# EAGLE design source_eagle (EAGLE 6.3)
COMPANY: ADAFRUIT INDUSTRIES; DRAWN: LADYADA; REV: A
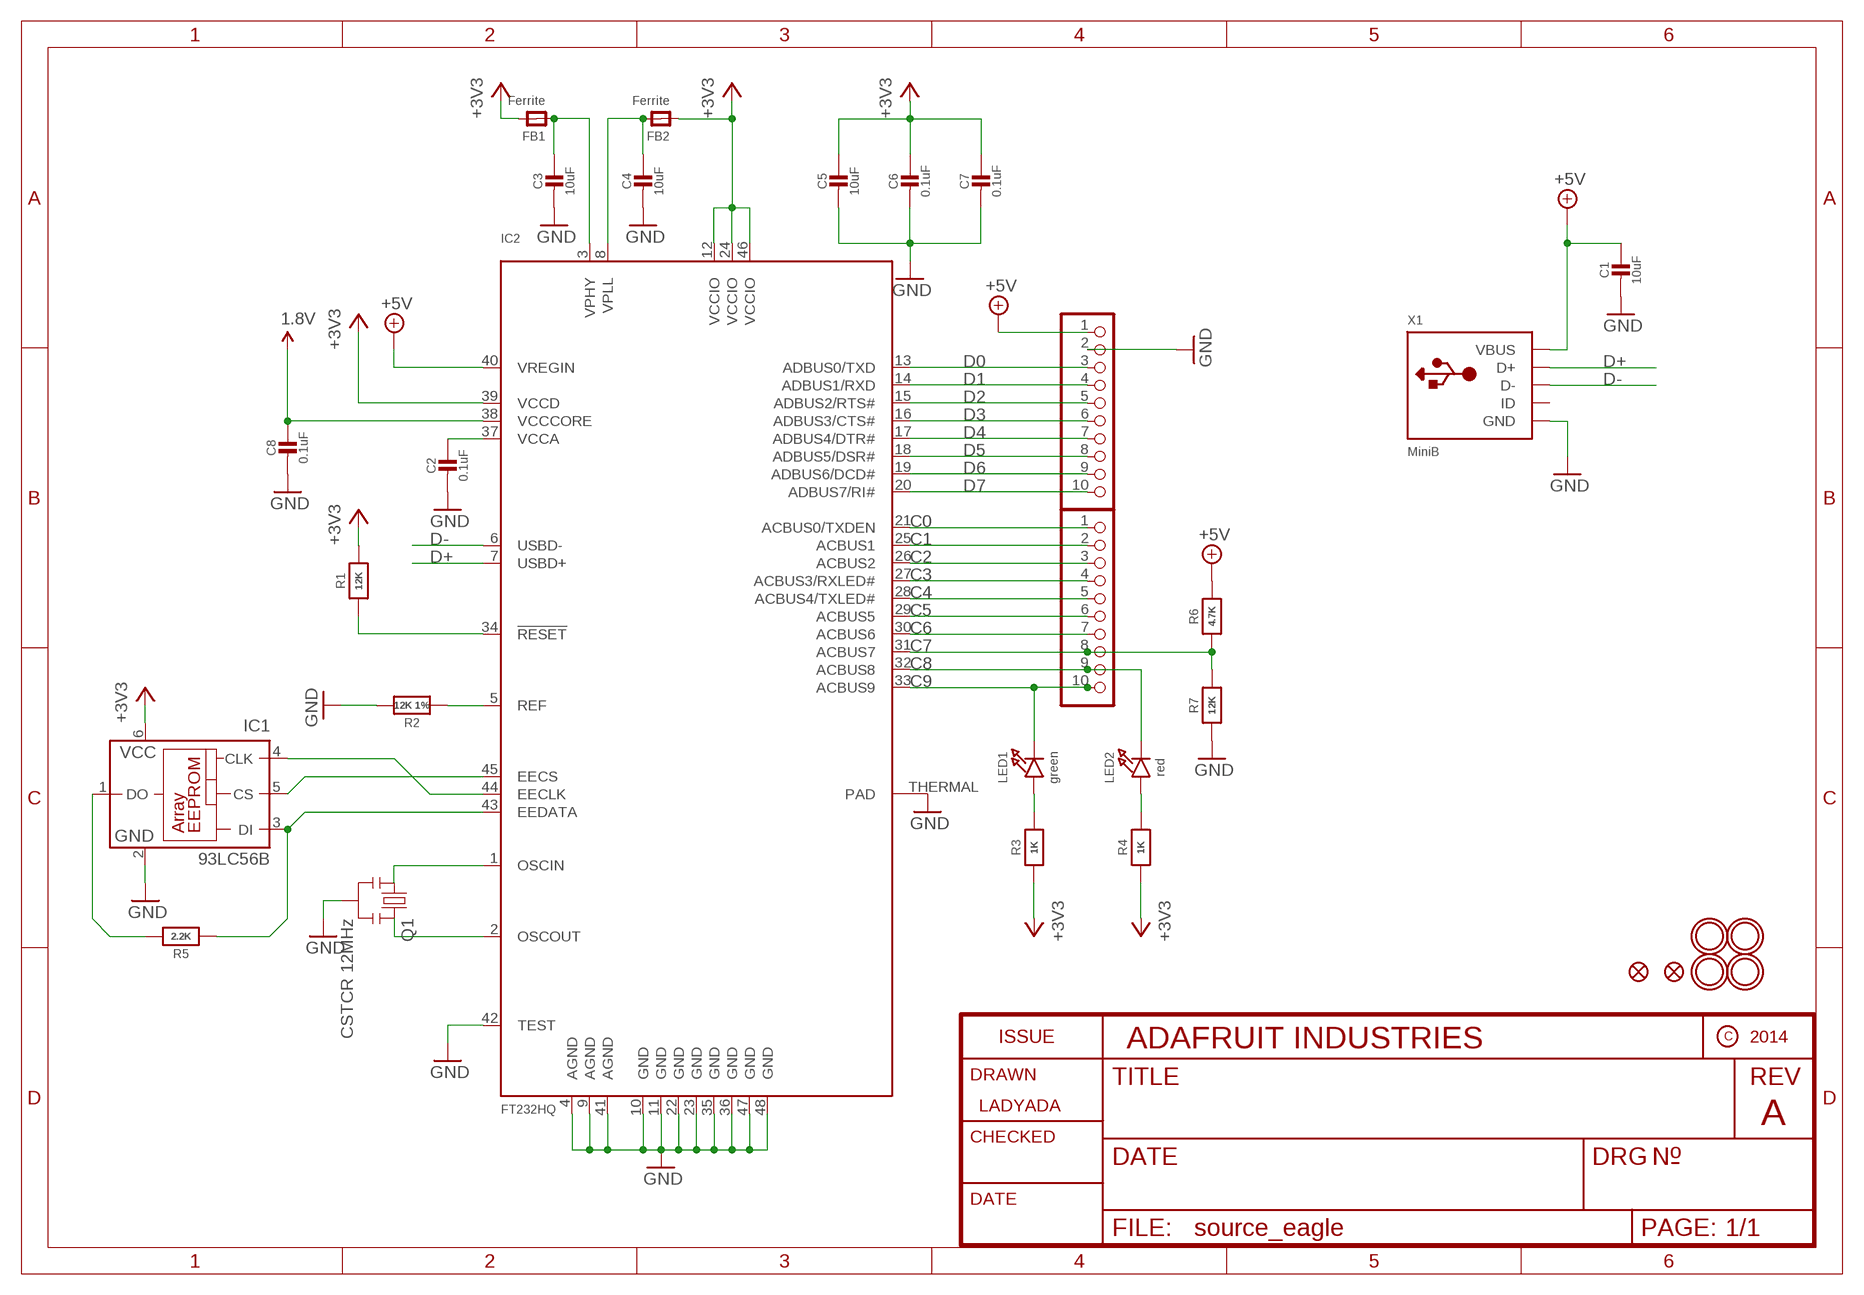
[diagram p0: schematic, sheet 1]

## Parts
C1  10uF  CAP_CERAMIC0805-NOOUTLINE  [0805-NO]
C2  0.1uF  CAP_CERAMIC0805-NOOUTLINE  [0805-NO]
C3  10uF  CAP_CERAMIC0805-NOOUTLINE  [0805-NO]
C4  10uF  CAP_CERAMIC0805-NOOUTLINE  [0805-NO]
C5  10uF  CAP_CERAMIC0805-NOOUTLINE  [0805-NO]
C6  0.1uF  CAP_CERAMIC0805-NOOUTLINE  [0805-NO]
C7  0.1uF  CAP_CERAMIC0805-NOOUTLINE  [0805-NO]
C8  0.1uF  CAP_CERAMIC0805-NOOUTLINE  [0805-NO]
FB1  Ferrite  FERRITE_0805  [_0805]
FB2  Ferrite  FERRITE_0805  [_0805]
FID1  FIDUCIAL""  [FIDUCIAL_1MM]
FID2  FIDUCIAL""  [FIDUCIAL_1MM]
IC1  93LC56B  93LC76A  [SOT23-6]
IC2  FT232HQ  [QFN48_8MM]
LED1  green  LED0805_NOOUTLINE  [CHIPLED_0805_NOOUTLINE]
LED2  red  LED0805_NOOUTLINE  [CHIPLED_0805_NOOUTLINE]
Q1  CSTCR 12MHz  RESONATORSMD  [RESONATOR-SMD]
R1  12K  RESISTOR0805_NOOUTLINE  [0805-NO]
R2  12K 1%  RESISTOR0805_NOOUTLINE  [0805-NO]
R3  1K  RESISTOR0805_NOOUTLINE  [0805-NO]
R4  1K  RESISTOR0805_NOOUTLINE  [0805-NO]
R5  2.2K  RESISTOR_0805MP  [_0805MP]
R6  4.7K  RESISTOR0805_NOOUTLINE  [0805-NO]
R7  12K  RESISTOR0805_NOOUTLINE  [0805-NO]
U$2  PINHD-1X10  [1X10-BIG]
U$3  PINHD-1X10  [1X10-BIG]
U$4  MOUNTINGHOLE2.5  [MOUNTINGHOLE_2.5_PLATED]
U$5  MOUNTINGHOLE2.5  [MOUNTINGHOLE_2.5_PLATED]
U$6  MOUNTINGHOLE2.5  [MOUNTINGHOLE_2.5_PLATED]
U$7  MOUNTINGHOLE2.5  [MOUNTINGHOLE_2.5_PLATED]
X1  MiniB  USBMICRO_20329  [4UCONN_20329]

## Nets
1.8V: C8.1 IC2.38(VCCCORE)
+3V3: C5.1 C6.1 C7.1 FB1.2 FB2.1 IC1.6(VCC) IC2.12(VCCIO) IC2.24(VCCIO) IC2.39(VCCD) IC2.46(VCCIO) R1.2 R3.1 R4.1
+5V: C1.1 IC2.40(VREGIN) R6.2 U$2.1 X1.VBUS
C0: IC2.21(ACBUS0/TXDEN) U$3.1
C1: IC2.25(ACBUS1) U$3.2
C2: IC2.26(ACBUS2) U$3.3
C3: IC2.27(ACBUS3/RXLED#) U$3.4
C4: IC2.28(ACBUS4/TXLED#) U$3.5
C5: IC2.29(ACBUS5) U$3.6
C6: IC2.30(ACBUS6) U$3.7
C7: IC2.31(ACBUS7) R6.1 R7.2 U$3.8
C8: IC2.32(ACBUS8) LED2.C U$3.9
C9: IC2.33(ACBUS9) LED1.C U$3.10
D0: IC2.13(ADBUS0/TXD) U$2.3
D1: IC2.14(ADBUS1/RXD) U$2.4
D2: IC2.15(ADBUS2/RTS#) U$2.5
D3: IC2.16(ADBUS3/CTS#) U$2.6
D4: IC2.17(ADBUS4/DTR#) U$2.7
D5: IC2.18(ADBUS5/DSR#) U$2.8
D6: IC2.19(ADBUS6/DCD#) U$2.9
D7: IC2.20(ADBUS7/RI#) U$2.10
D+: IC2.7(USBD+) X1.D+
D-: IC2.6(USBD-) X1.D-
GND: C1.2 C2.2 C3.2 C4.2 C5.2 C6.2 C7.2 C8.2 IC1.2(GND) IC2.4(AGND) IC2.9(AGND) IC2.10(GND) IC2.11(GND) IC2.22(GND) IC2.23(GND) IC2.35(GND) IC2.36(GND) IC2.41(AGND) IC2.42(TEST) IC2.47(GND) IC2.48(GND) IC2.THERMAL(PAD) Q1.2 R2.2 R7.1 U$2.2 X1.BASE@1(GND) X1.BASE@2(GND) X1.GND X1.SPRT@1(GND) X1.SPRT@2(GND) X1.SPRT@3(GND) X1.SPRT@4(GND)
N$2: IC2.1(OSCIN) Q1.1
N$3: IC2.2(OSCOUT) Q1.3
N$5: IC2.5(REF) R2.1
N$6: LED2.A R4.2
N$7: IC2.34(!RESET) R1.1
N$8: LED1.A R3.2
N$9: IC1.3(DI) IC2.43(EEDATA) R5.1
N$10: IC1.5(CS) IC2.45(EECS)
N$11: IC1.4(CLK) IC2.44(EECLK)
N$12: IC1.1(DO) R5.2
VCCA: C2.1 IC2.37(VCCA)
VPHY: C3.1 FB1.1 IC2.3(VPHY)
VPLL: C4.1 FB2.2 IC2.8(VPLL)
Unconnected: X1.ID

## Library data of the parts
C1-C8 = microbuilder:CAP_CERAMIC: Ceramic Capacitors For new designs, use the packages preceded by an '_' character since they are more reliable: The following footprints should be used on most boards: _0402 - Standard footprint for regular board layouts _0603 - Standard footprint for regular board layouts _0805 - Standard footprint for regular board layouts _1206 - Standard footprint for regular board layouts For extremely tight-pitch boards where space is at a premium, the following 'micro-pitch' footprints can be used (smaller pads, no silkscreen outline, etc.): _0402MP - Micro-pitch footprint for very dense/compact boards _0603MP - Micro-pitch footprint for very dense/compact boards _0805MP - Micro-pitch footprint for very dense/compact boards _1206MP - Micro-pitch footprint for very dense/compact boards
FB1 FB2 = microbuilder:FERRITE: Ferrite Bead 0603 MMZ1608B121C - 120 Ohm @ 100MHz, 600mA, 0.15 Ohm DC Resistance - Digikey: 445-2164-1-ND BK1608HW121-T - 120 Ohm, 600mA Ferrite Chip - Digikey: 587-1876-2-ND 0805 HZ0805B272R-10 - 2.7K Ohm @ 100MHz, 200mA, 0.8 Ohm DC Resistance - Digikey: 240-2504-1-ND (see also Murata BLM21BD272SN1L) MMZ2012Y152B - 1.5K Ohm @ 100MHz, 500mA, 0.4 Ohm DC Resistance - Digikey: 445-1560-1-ND - Mainly for high frequency (80-400MHz) MMZ2012R102A - 1K Ohm @ 100MHz, 500mA, 0.3 Ohm DC Resistance - Digikey: 445-1555-2-ND - More general purpose (10-200MHz)
FID1 FID2 = microbuilder:FIDUCIAL: Fiducial Alignment Points Various fiducial points for machine vision alignment.; BOM: EXCLUDE
IC1 = microchip:93*76?: 8K Microwire Compatible Serial EEPROM Source: http://ww1.microchip.com/downloads/en/DeviceDoc/21796H.pdf; MF: MICROCHIP; MPN: 93LC76AT-I/OT; OC_FARNELL: 1556170; OC_NEWARK: 61H6824
IC2 = microbuilder:FT232H
LED1 LED2 = microbuilder:LED: LED 0603 - 0603 Surface Mount Package 2mA: Green LED - Low Power (3.9mcd, 2ma, 1.7Vf) - Digikey: 475-2709-2-ND Orange LED - Low Power (9.8mcd, 2ma, 1.8Vf) - Digikey: 475-1194-2-ND Red LED - Low Power (5mcd, 2ma, 1.8Vf) - Digikey: 475-1195-2-ND Yellow LED - Low Power (7mcd, 2ma, 1.8Vf) - Digikey: 475-1196-2-ND 5mA: Blue LED - Low Power (17mcd, 5ma, 2.9Vf) - Digikey: LNJ937W8CRACT-ND 0805 - 0805 Surface Mount Package 2mA: Red LED (8.8mcd, 2mA, 1.8Vf, Clear) - Low Power [Digikey: 475-2510-1-ND] Green LED (5mcd, 2mA, 1.8Vf, Clear) - Low Power [Digikey: 475-2730-1-ND] Yellow LED (11.3mcd, 2mA, 1.8Vf, Clear) - Low Power [Digikey: 475-2555-1-ND] 20mA: Red LED (104mcd, 20mA, Diffused) - LS R976 [Digikey: 475-1278-6-ND] Red LED (12mcd, 20mA, 2.0Vf, Clear) - APT2012EC [Digikey: 754-1128-1-ND] Green LED (15mcd, 20mA, 2.2Vf, Clear) - APT2012GC [Digikey: 754-1131-1-ND] Orange LED (160mcd, 20mA, 2.1Vf, Clear) - APT2012SECK [Digikey: 754-1130-1-ND] 1206 - 1206 Surface Mount Package Green LED (26mcd, 20mA, Diffused) - LG N971 [Digikey: 475-1407-6-ND] Red LED (15mcd, 20mA, Diffused) - LH N974 [Digikey: 475-1416-6-ND] Cree - Cree High-Power Surface Mount LEDs XPEBWT-L1-0000-00D50 - White 111lm 350mA 2.9Vf 6200K 110° XTEAWT-00-0000-00000LEE3 - White 114lm 350mA 2.85Vf 5000K 115° Everlight - Everlight 45-21 Series Surface Mount LEDs 45-21/QK2C-B2832AC2CB2/2T - Warm White 2000mcd 20mA 3.25Vf 3050K 120° 45-21/LK2C-B38452C4CB2/2T - Nuetral White 2000mcd 20mA 3.25Vf 4150K 120° 45-21/LK2C-B50634C6CB2/2T - Cold White 2200mcd 20mA 3.25Vf 5650K 120° PLCC2 Reverse Mount LS T77K-J1L2-1-0-2-R18-Z - Red 11.25mcd 2mA 1.8Vf 630nm 120° LO T77K-L1M2-24-Z - Orange 19.6mcd 2mA 1.8Vf 606nm 120° LY T77K-K2M1-26-Z - Yellow 15.7mcd 2mA 1.8Vf 587nm 120°
Q1 = SparkFun:RESONATOR: Resonator Small SMD resonator. This is the itty bitty 10/20MHz resonators with built in caps. CSTCE10M0G55 and CSTCE20M0V53. Footprint has been reviewed closely but hasn't been tested yet.
R1-R7 = microbuilder:RESISTOR: Resistors For new designs, use the packages preceded by an '_' character since they are more reliable: The following footprints should be used on most boards: _0402 - Standard footprint for regular board layouts _0603 - Standard footprint for regular board layouts _0805 - Standard footprint for regular board layouts _1206 - Standard footprint for regular board layouts For extremely tight-pitch boards where space is at a premium, the following 'micro-pitch' footprints can be used (smaller pads, no silkscreen outline, etc.): _0402MP - Micro-pitch footprint for very dense/compact boards _0603MP - Micro-pitch footprint for very dense/compact boards _0805MP - Micro-pitch footprint for very dense/compact boards _1206MP - Micro-pitch footprint for very dense/compact boards
U$2 U$3 = adafruit2:PINHD-1X10: Pin header 1x10 0.1" spacing With round pins
U$4-U$7 = microbuilder:MOUNTINGHOLE: Mounting Hole For #2 screws (0.086"/2.18mm width, 0.094"/2.4mm hole) use 2.5mm; BOM: EXCLUDE
X1 = microbuilder:USB: USB Connectors USBMINIB - Surface Mount Female Mini-B USB Connector 4UConnector: 06564

## Board
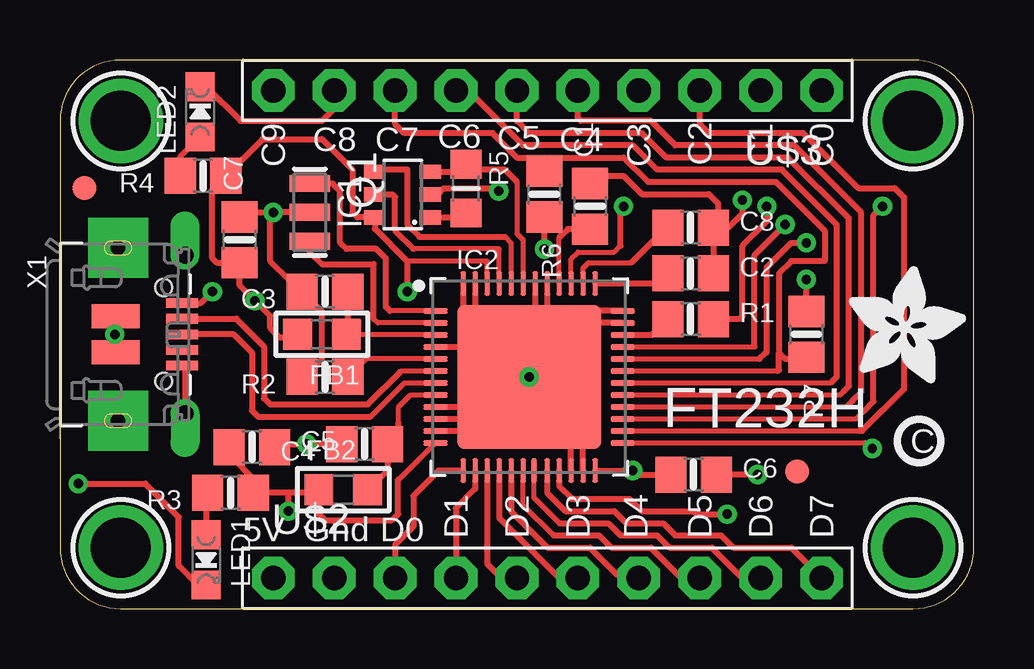
[diagram p1: board, top side]
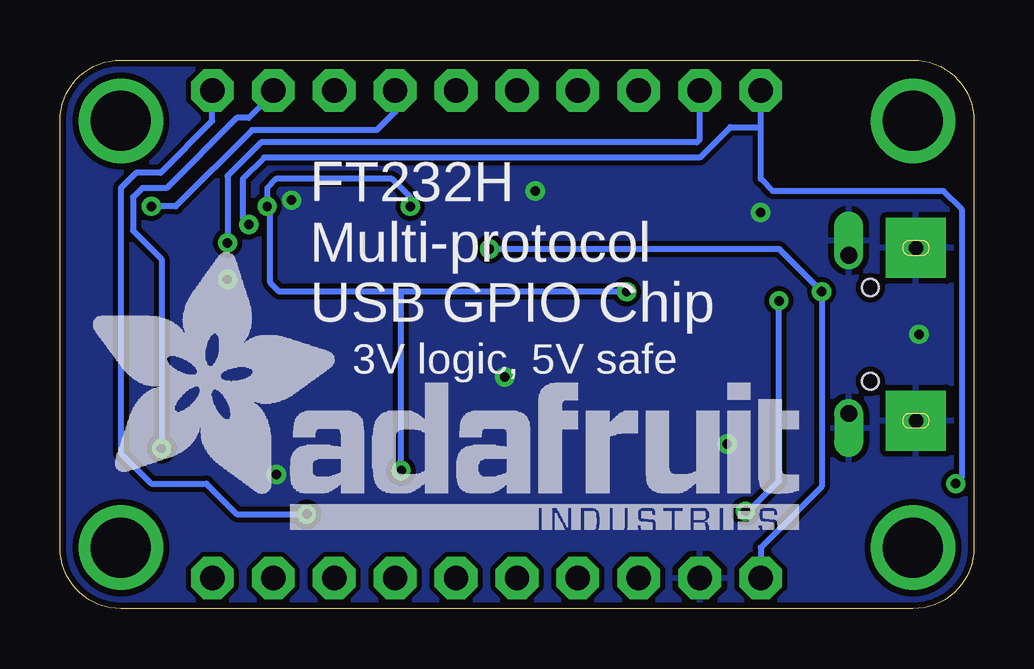
[diagram p2: board, bottom side, seen from below]

Size 38.1 x 22.86 mm. Coordinates in mm from the lower left corner, seen from the top.
Outline: 0,20.32 0,2.54 arc90 2.54,0 35.56,0 arc90 38.1,2.54 38.1,20.32 arc90 35.56,22.86 2.54,22.86 arc90 0,20.32
Copper layers (1*16): Top 0.035mm / dielectric 1.5mm / Bottom 0.035mm
Design rules "adafruit *": minimum track width 8mil, minimum drill 15.5mil, track to track 8mil, track to pad 8mil, pad to pad 8mil, via to via 8mil, smd to smd 8mil, copper to edge 10mil, drill to drill 8mil, minimum pad ring 10mil, minimum via ring 8mil, stop-mask expansion 2mil, vias tented up to drill 20mil, thermal gap 10mil

### Footprints (pad centres in the part's own frame; a part is rotated, then mirrored left to right if it is on the bottom)
0805-NO = smd 1.3 x 1.5: 1 -0.95,0; 2 0.95,0
_0805 = smd 1.2 x 1.3: 1 -1.016,0; 2 1.016,0
FIDUCIAL_1MM = smd 1 x 1: 1 0,0
SOT23-6 = smd 0.6 x 0.9: 1 -0.95,-1.15; 2 0,-1.15; 3 0.95,-1.15; 4 0.95,1.15; 5 0,1.15; 6 -0.95,1.15
QFN48_8MM = smd 1 x 0.23: 1 -3.9,2.75; 2 -3.9,2.25; 3 -3.9,1.75; 4 -3.9,1.25; 5 -3.9,0.75; 6 -3.9,0.25; 7 -3.9,-0.25; 8 -3.9,-0.75; 9 -3.9,-1.25; 10 -3.9,-1.75; 11 -3.9,-2.25; 12 -3.9,-2.75; 25 3.9,-2.75; 26 3.9,-2.25; 27 3.9,-1.75; 28 3.9,-1.25; 29 3.9,-0.75; 30 3.9,-0.25; 31 3.9,0.25; 32 3.9,0.75; 33 3.9,1.25; 34 3.9,1.75; 35 3.9,2.25; 36 3.9,2.75 | smd 0.23 x 1: 13 -2.75,-3.9; 14 -2.25,-3.9; 15 -1.75,-3.9; 16 -1.25,-3.9; 17 -0.75,-3.9; 18 -0.25,-3.9; 19 0.2,-3.9; 20 0.75,-3.9; 21 1.25,-3.9; 22 1.75,-3.9; 23 2.25,-3.9; 24 2.75,-3.9; 37 2.75,3.9; 38 2.25,3.9; 39 1.75,3.9; 40 1.25,3.9; 41 0.75,3.9; 42 0.25,3.9; 43 -0.25,3.9; 44 -0.75,3.9; 45 -1.25,3.9; 46 -1.75,3.9; 47 -2.25,3.9; 48 -2.75,3.9 | smd 6 x 6: THERMAL 0,0
CHIPLED_0805_NOOUTLINE = smd 1.2 x 1.2: A 0,-1.05; C 0,1.05
RESONATOR-SMD = smd 0.7 x 1.7: 1 -1.2,0; 2 0,0; 3 1.2,0
_0805MP = smd 1.2 x 1.3: 1 -1.016,0; 2 1.016,0
1X10-BIG = drill 1.016 pad 1.778 octagon: 1 -11.43,0; 2 -8.89,0; 3 -6.35,0; 4 -3.81,0; 5 -1.27,0; 6 1.27,0; 7 3.81,0; 8 6.35,0; 9 8.89,0; 10 11.43,0
MOUNTINGHOLE_2.5_PLATED = drill 2.5 pad 3.2: P$1 0,0
4UCONN_20329 = smd 1 x 2: BASE@1 -0.75,-2; BASE@2 0.75,-2 | smd 0.4 x 1.35: D+ 0,0.775; D- -0.65,0.775; GND 1.3,0.775; ID 0.65,0.775; VBUS -1.3,0.775 | drill 0.7 offset: SPRT@1 -3.3,0.9; SPRT@2 3.3,0.9 | drill 0.6 pad 2.5 square: SPRT@3 -3.6,-1.9; SPRT@4 3.6,-1.9 | hole 0.7: -1.95,0; 1.95,0

### Placement (x,y rotation side)
C1  22.1,16.76 90 top
C2  26.29,13.97 0 top
C3  11.05,13.21 180 top
C4  12.7,6.86 180 top
C5  8,6.73 0 top
C6  26.42,5.59 0 top
C7  7.49,15.37 90 top
C8  26.29,15.88 0 top
FB1  10.92,11.43 180 top
FB2  11.81,4.95 0 top
FID1  1.02,17.53 0 top
FID2  30.73,5.71 0 top
IC1  14.28,17.25 90 top
IC2  19.56,9.65 0 top
LED1  6.1,2.03 180 top
LED2  5.84,20.7 0 top
Q1  10.41,16.51 270 top
R1  26.29,12.06 0 top
R2  11.05,9.65 180 top
R3  7.11,4.83 180 top
R4  5.97,18.03 180 top
R5  16.92,17.5 270 top
R6  20.19,17.27 270 top
R7  31.11,11.43 270 top
U$2  20.32,1.27 0 top
U$3  20.32,21.59 180 top
U$4  2.54,20.32 0 top
U$5  2.54,2.54 0 top
U$6  35.56,20.32 0 top
U$7  35.56,2.54 0 top
U$8  [ADAFRUIT_5MM]  32.89,9.4 0 top
U$9  [ADAFRUIT_TEXT_30MM]  36.96,3.3 0 bottom
U$11  [PCBFEAT-REV-040]  35.81,6.99 0 top
X1  4.32,11.43 270 top

### Tracks (layer width: path | path; a pad name or v marks a point on that pad's centre or on a via)
1.8V
  Top 0.203: IC2.38 21.81,14.19 22.04,14.41 23.81,14.41
  Top 0.254: 23.81,14.41 25.27,15.88 C8.1
+3V3  (via drill 0.39)
  Top 0.203: IC2.12 14.14,5.38 14.1,5.38 | IC2.39 21.31,14.58 21.59,14.86 23.11,14.86 23.37,15.11 | IC2.46 17.81,14.48 14.48,14.48
  Top 0.254: 10.79,4.76 FB2.1 | FB2.1 10.79,3.94 11.05,3.68 13.84,3.68 14.1,3.94 14.1,5.38 | IC2.24 v23.88,5.75 24.04,5.59 C6.1 | FB1.2 9.78,11.3 9.14,11.3 8.76,11.68 8.76,12.19 v8.13,12.83 7.49,13.46 C7.1 6.54,14.42 6.35,14.61 6.35,17.46 R4.1 8.44,19.56 10.92,19.56 12.19,18.29 12.19,16.51 12.4,16.3 IC1.6 13.13,15.82 14.48,14.48 v14.48,13.21 | FB2.1 10.54,4.95 | 23.37,15.11 23.37,16.64 v23.5,16.76 | v29.46,16.76 29.46,16.13 28.45,15.11 28.45,12.19 28.32,12.06 R1.2 27.3,12.13 | C5.1 7.05,6.43 8.18,5.3 8.1,5.3 8.06,5.26 R3.1 9.53,4.83 | FB2.1 10.67,4.83 9.53,4.83 | v9.53,4.06 9.53,4.83
  Bottom 0.254: v8.13,12.83 8.13,5.33 9.4,4.06 v9.53,4.06 | v14.48,13.21 23.88,13.21 | 23.88,13.21 28.96,13.21 29.34,13.59 29.34,16.64 v29.46,16.76 29.46,17.53 29.08,17.91 24.26,17.91 23.5,17.14 v23.5,16.76 | v23.88,5.75 23.88,13.21
+5V  (via drill 0.39)
  Top 0.203: IC2.40 20.81,15.45
  Top 0.254: X1.VBUS 5.87,12.73 v6.35,13.21 | C1.1 21.17,15.81 20.96,15.61 | 20.96,15.61 20.81,15.45 | 20.96,15.61 20.25,16.32 R6.2 v20.19,14.99
  Bottom 0.254: U$2.1 8.89,2.54 6.35,5.08 v6.35,13.21 8.13,14.99 v20.19,14.99
C0  (via drill 0.39)
  Top 0.254: IC2.21 20.81,5.1 21.34,4.57 23.75,4.57 24.26,4.06 26.42,4.06 26.54,3.94 v27.81,3.94
  Bottom 0.254: v27.81,3.94 30.73,3.94 32,5.21 34.29,5.21 35.56,6.48 35.56,17.53 34.92,18.16 33.91,18.16 31.75,20.32 U$3.1
C1  (via drill 0.39)
  Top 0.203: IC2.25 33.57,6.9
  Top 0.254: 33.57,6.9 33.8,6.67 v33.87,6.67
  Bottom 0.254: U$3.2 29.21,21.46 30.23,20.45 30.73,20.45 33.66,17.53 34.67,17.53 35.05,17.14 35.05,15.75 33.87,14.56 v33.87,6.67
C2
  Top 0.203: IC2.26 33.31,7.4
  Top 0.254: U$3.3 26.67,20.19 27.05,19.81 30.99,19.81 33.27,17.53 34.8,17.53 35.18,17.14 35.18,9.14 33.44,7.4 33.31,7.4
C3  (via drill 0.39)
  Top 0.203: IC2.27 33.17,7.9 33.52,8.25
  Top 0.254: 33.52,8.25 33.91,8.64 33.91,16.38 v34.29,16.76
  Bottom 0.254: U$3.4 24.13,20.7 24.89,19.94 30.1,19.94 33.27,16.76 v34.29,16.76
C4
  Top 0.203: IC2.28 32.79,8.4 33.04,8.65
  Top 0.254: 33.04,8.65 33.4,9.02 33.4,16.51 30.61,19.3 25.65,19.3 24.64,20.32 21.72,20.32 21.59,20.45 U$3.5
C5
  Top 0.203: IC2.29 32.52,8.9 32.67,9.05
  Top 0.254: 32.67,9.05 32.89,9.27 32.89,16.26 30.35,18.8 25.27,18.8 24.26,19.81 19.56,19.81 19.05,20.32 U$3.6
C6
  Top 0.203: IC2.30 32.13,9.4 32.19,9.45
  Top 0.254: 32.19,9.45 32.38,9.65 32.38,16 30.1,18.29 24.89,18.29 23.88,19.3 19.3,19.3 17.02,21.59 U$3.7
C7
  Top 0.203: IC2.31 29.92,9.9
  Top 0.254: 20.19,18.8 19.05,18.8 18.03,19.81 14.35,19.81 13.97,20.19 U$3.8 | 20.19,18.8 23.5,18.8 24.51,17.78 29.84,17.78 31.88,15.75 31.88,14.48 30.48,14.48 29.97,13.97 29.97,10.67 | R6.1 20.19,18.8 | 29.97,10.67 30.23,10.41 31.05,10.41 R7.2 | 29.92,9.9 29.97,9.95 29.97,10.67
C8  (via drill 0.39)
  Top 0.203: IC2.32 29.16,10.4
  Top 0.254: U$3.9 11.43,20.83 10.92,20.32 7.53,20.32 6.1,21.75 LED2.C | v31.11,15.24 30.48,15.24 29.46,14.22 29.46,10.67 29.43,10.67 29.16,10.4
  Bottom 0.254: v31.11,15.24 31.11,18.03 29.72,19.43 11.56,19.43 11.43,19.56 U$3.9
C9  (via drill 0.39)
  Top 0.203: IC2.33 28.94,10.9 28.96,10.92
  Top 0.254: 28.96,10.92 28.96,14.73 v30.23,16 | LED1.C 5.75,0.98 4.95,1.78 4.95,3.81 3.56,5.21 v0.76,5.21
  Bottom 0.254: v30.23,16 30.48,16.26 30.48,17.91 29.59,18.8 11.43,18.8 10.16,20.07 8.89,20.07 | 8.89,20.07 8.89,17.91 8.38,17.4 1.27,17.4 0.51,16.64 0.51,5.46 v0.76,5.21 | 8.89,20.07 U$3.10
D0
  Top 0.254: IC2.13 15.79,5.75 14.73,4.7 14.73,3.43 13.97,2.67 U$2.3
D1
  Top 0.254: IC2.14 17.31,4.99 16.51,4.19 U$2.4
D2
  Top 0.254: IC2.15 17.81,1.88 18.41,1.27 U$2.5
D3
  Top 0.254: IC2.16 18.31,3.79 20.83,1.27 U$2.6
D4
  Top 0.254: IC2.17 18.81,4.05 20.32,2.54 22.1,2.54 23.24,1.4 24,1.4 U$2.7
D5
  Top 0.203: 20.57,3.05 19.31,4.31 IC2.18
  Top 0.254: 20.57,3.05 22.48,3.05 22.99,2.54 24.64,2.54 25.91,1.27 U$2.8
D6
  Top 0.203: 20.83,3.56 19.76,4.63 IC2.19
  Top 0.254: 20.83,3.56 22.86,3.56 23.37,3.05 24.89,3.05 25.4,2.54 27.18,2.54 28.45,1.27 U$2.9
D7
  Top 0.254: IC2.20 20.31,4.84 21.08,4.06 23.11,4.06 23.62,3.56 25.15,3.56 25.65,3.05 27.56,3.05 28.07,2.54 30.48,2.54 U$2.10
D+
  Top 0.203: 12.95,8 14.36,9.4 IC2.7
  Top 0.254: 12.95,8 8.26,8 8,8.26 8,10.67 7.24,11.43 X1.D+
D-
  Top 0.203: 14.17,9.85 14.22,9.9 IC2.6
  Top 0.254: 14.17,9.85 12.83,8.51 8.76,8.51 8.51,8.76 8.51,10.92 7.35,12.08 X1.D-
GND  (via drill 0.39)
  Top 0.203: IC2.42
  Top 0.254: C4.2 v10.29,6.86 9.08,6.86 C5.2 | 20.96,8.25 IC2.THERMAL | Q1.2 v8.89,16.51 | R7.1 v31.11,13.72 | 27.49,14.22 C2.2 C8.2 | v29.08,5.59 C6.2 | v18.29,17.4 18.18,17.51 15.98,17.51 15.73,17.25 IC1.2 | v28.45,17.02 28.45,16.45 27.87,15.88 C8.2 | X1.BASE@1 X1.BASE@2 2.29,10.71 v2.29,11.43 | X1.GND 5.22,10.01 X1.SPRT@2 | v8.89,16.51 8.76,16.51 8.76,14.48 9.53,13.72 9.59,13.72 C3.2 10.92,12.38 10.92,10.41 10.16,9.65 R2.2 | C7.2 7.69,16.51 v8.89,16.51 | C1.2 22.29,17.71 22.61,18.03 23.5,18.03 24.26,17.27 27.05,17.27 27.43,16.89 27.43,16.07 C8.2 | IC2.22 21.31,7.75 | 21.31,7.75 21.31,7.9 IC2.THERMAL | IC2.23 21.81,7.25 21.31,7.75 | IC2.48 16.81,12.4 IC2.THERMAL | IC2.47 17.31,11.9 IC2.THERMAL | IC2.4 18.31,10.9 IC2.THERMAL | IC2.41 20.31,10.4 IC2.THERMAL | IC2.36 22.31,12.4 IC2.THERMAL | IC2.35 21.81,11.9 IC2.THERMAL | IC2.42 19.81,9.9 IC2.THERMAL | IC2.11 17.31,7.4 IC2.THERMAL | IC2.10 17.81,7.9 IC2.THERMAL | IC2.9 18.31,8.4 IC2.THERMAL
  other vias: 19.56,9.65
  pour Bottom: 0,22.86 0,0 37.97,0 37.97,22.86
N$2
  Top 0.203: IC2.1 13.76,12.4
  Top 0.254: Q1.1 11.37,17.71 11.68,17.4 11.68,15.24 11.94,14.99 13.18,14.99 13.59,14.58 13.59,12.57 13.76,12.4
N$3
  Top 0.203: IC2.2 13.24,11.9 13.08,12.06
  Top 0.254: 13.08,12.06 13.08,14.35 10.92,14.35 10.41,14.86 Q1.3 10.41,15.34
N$5
  Top 0.203: IC2.5 12.75,10.4
  Top 0.254: 12.75,10.4 R2.1
N$6
  Top 0.254: R4.2 5.02,18.83 LED2.A
N$7
  Top 0.254: IC2.34 24.68,11.4 R1.1
N$8
  Top 0.254: R3.2 6.1,4.76 LED1.A
N$9
  Top 0.203: 19.05,17.78 19.05,15.62 19.3,15.37 IC2.43
  Top 0.254: 19.05,17.78 18.54,18.29 17.15,18.29 R5.1 16.61,18.2 IC1.3
N$10
  Top 0.203: IC2.45 18.31,14.99 14.73,14.99
  Top 0.254: 14.73,14.99 13.97,15.75 13.97,17.14 13.86,17.25 IC1.5
N$11
  Top 0.203: 18.54,15.49 18.81,15.23 IC2.44
  Top 0.254: 18.54,15.49 14.99,15.49 14.48,16 14.48,18.29 13.22,18.29 IC1.4
N$12
  Top 0.254: IC1.1 16.74,16.3 R5.2
VCCA
  Top 0.254: IC2.37 24.92,13.55 C2.1
VPHY
  Top 0.203: IC2.3 12.47,11.4 12.45,11.43
  Top 0.254: C3.1 12,11.62 11.94,11.56 FB1.1 12.45,11.94 12.45,11.43
VPLL
  Top 0.203: 14.1,7.75 14.1,8.38 14.62,8.9 IC2.8
  Top 0.254: 14.1,7.75 14.1,7.3 C4.1 13.65,5.78 FB2.2 12.76,5.02

### Text on the board
tPlace: C8 | C7 | C6 | C5 | C4 | C9 | C3 | C2 | C1 | C0 | FT232H | 5V | Gnd | D0 | D1 | D2 | D3 | D4 | D5 | D6 | D7
bPlace: FT232H / Multi-protocol / USB GPIO Chip | 3V logic, 5V safe